# Altium schematic sheet Sheet1.SchDoc: Ranja
size B; Date: 09/30/26; Author: Peter Adebayo; DrawnBy: Peter Adebayo; Engineer: Peter Adebayo; Revision: v1; SheetNumber: 1; SheetTotal: 1; SPICEModelCacheJIALTRMA: <root> / <DocumentId>JIALTRMA</DocumentId> / </root>
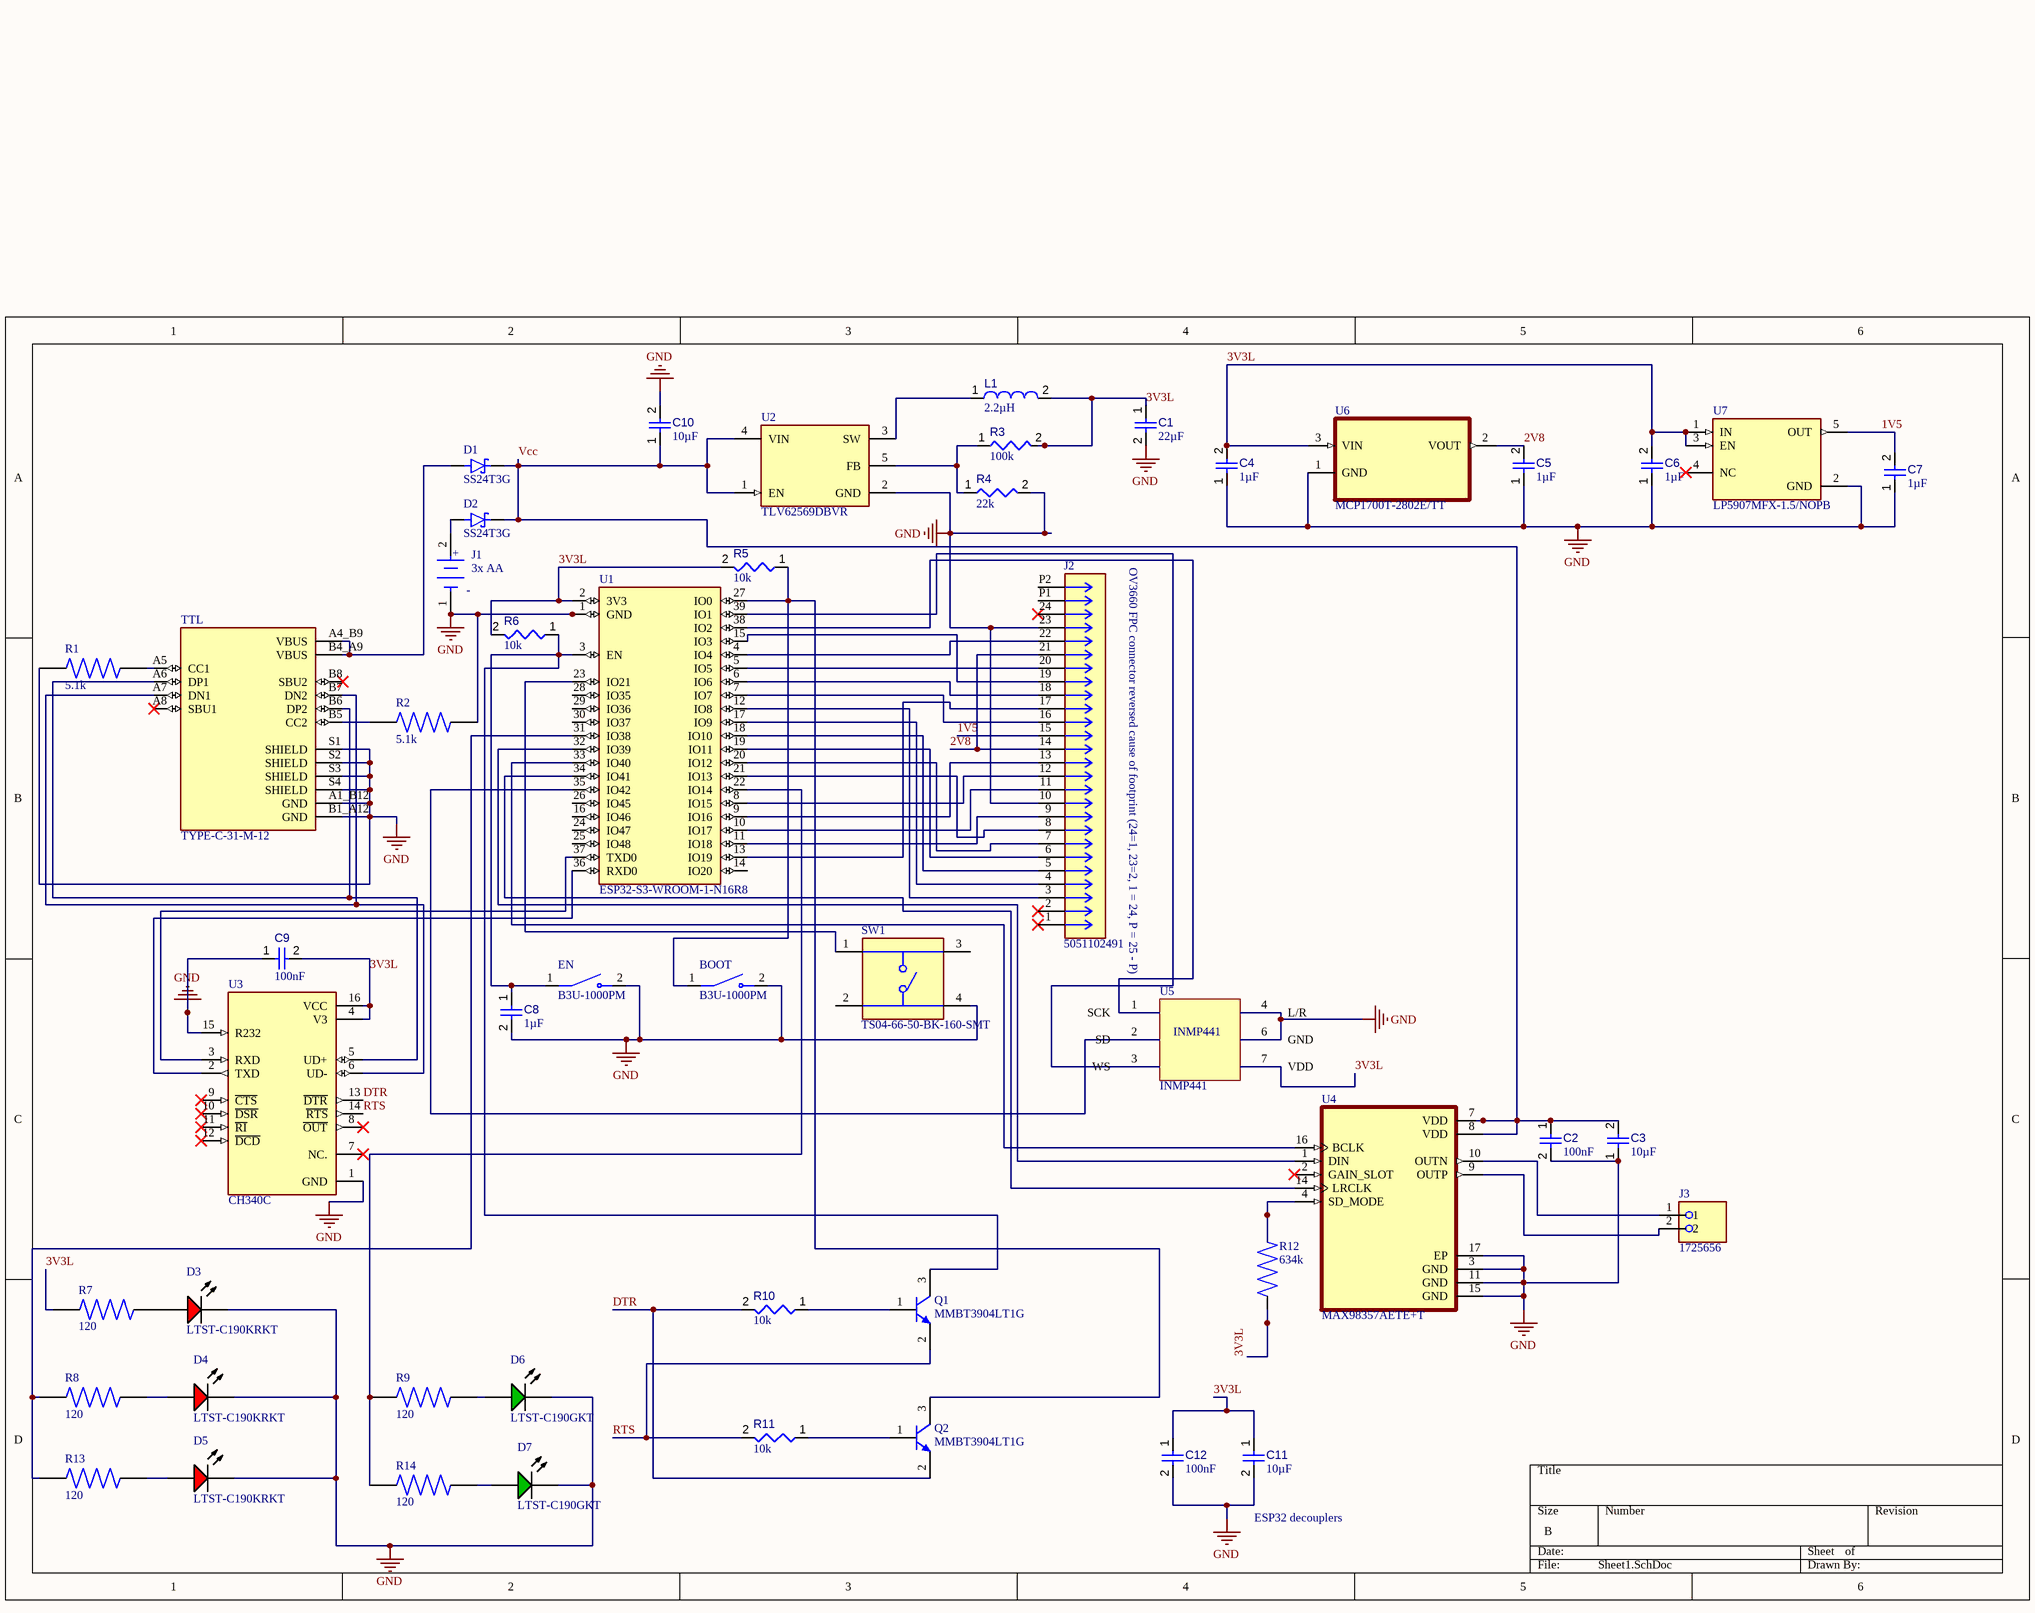
[diagram p0: Sheet1.SchDoc]

## Parts
BOOT  B3U-1000PM  [SW_B3U-1000PM]
C1  value 22µF  [CAPC0805(2012)145_L]  (hidden comment: Capacitor 22µF +/-40% 16V 0805)
C2  value 100nF  [CAPC0402(1005)60_L]  (hidden comment: Capacitor 100nF +/-20% 50V 0402)
C3  value 10µF  [CAPC2013X135X45LL10T25]  (hidden comment: Capacitor 10 uF +/- 10% 16 V 0805)
C4  value 1µF  [CAPC1608X90X35ML15T15]  (hidden comment: Capacitor 1uF +/- 10% 16V 0603)
C5  value 1µF  [CAPC1608X90X35ML15T15]  (hidden comment: Capacitor 1uF +/- 10% 16V 0603)
C6  value 1µF  [CAPC1608X90X35ML15T15]  (hidden comment: Capacitor 1uF +/- 10% 16V 0603)
C7  value 1µF  [CAPC1608X90X35ML15T15]  (hidden comment: Capacitor 1uF +/- 10% 16V 0603)
C8  value 1µF  [CAPC1608X90X35ML15T15]  (hidden comment: Capacitor 1uF +/- 10% 16V 0603)
C9  value 100nF  [CAPC0402(1005)60_L]  (hidden comment: Capacitor 100nF +/-20% 50V 0402)
C10  value 10µF  [CAPC2013X135X45LL10T25]  (hidden comment: Capacitor 10 uF +/- 10% 16 V 0805)
C11  value 10µF  [CAPC2013X135X45LL10T25]  (hidden comment: Capacitor 10 uF +/- 10% 16 V 0805)
C12  value 100nF  [CAPC0402(1005)60_L]  (hidden comment: Capacitor 100nF +/-20% 50V 0402)
D1  SS24T3G  [DIOM5436X247N]
D2  SS24T3G  [DIOM5436X247N]
D3  LTST-C190KRKT  [LTST-C191KRKT_V]
D4  LTST-C190KRKT  [LTST-C191KRKT_V]
D5  LTST-C190KRKT  [LTST-C191KRKT_V]
D6  LTST-C190GKT  [LTST-C190GKT_V]
D7  LTST-C190GKT  [LTST-C190GKT_V]
EN  B3U-1000PM  [SW_B3U-1000PM]
J1  3x AA  [FP-BC3AAPC-MFG]
J2  5051102491  [CON_5051102491_MOL]
J3  1725656  [PHOENIX_1725656]
L1  value 2.2µH  [INDC2520X100X60NL20T20]  (hidden comment: LQM2HPN2R2MG0L)
Q1  MMBT3904LT1G  [ONSC-SOT-23-3-318-08_V]
Q2  MMBT3904LT1G  [ONSC-SOT-23-3-318-08_V]
R1  value 5.1k  [RESC1005X40N]  (hidden comment: RC0402FR-075K1L)
R2  value 5.1k  [RESC1005X40N]  (hidden comment: RC0402FR-075K1L)
R3  value 100k  [RESC0402(1005)_L]  (hidden comment: Resistor 100K +/-1 % 0402 63 mW)
R4  value 22k  [RESC0402(1005)_L]  (hidden comment: Resistor 22K  +/-1 % 0402 63 mW)
R5  value 10k  [RESC0402(1005)_L]  (hidden comment: Resistor 10K  +/-1 % 0402 63 mW)
R6  value 10k  [RESC0402(1005)_L]  (hidden comment: Resistor 10K  +/-1 % 0402 63 mW)
R7  value 120  [RESC1608X55N]  (hidden comment: CRCW0603120RJNEAHP)
R8  value 120  [RESC1608X55N]  (hidden comment: CRCW0603120RJNEAHP)
R9  value 120  [RESC1608X55N]  (hidden comment: CRCW0603120RJNEAHP)
R10  value 10k  [RESC0402(1005)_L]  (hidden comment: Resistor 10K  +/-1 % 0402 63 mW)
R11  value 10k  [RESC0402(1005)_L]  (hidden comment: Resistor 10K  +/-1 % 0402 63 mW)
R12  value 634k  [RESC2012X60N]  (hidden comment: RT0805BRD07634KL)
R13  value 120  [RESC1608X55N]  (hidden comment: CRCW0603120RJNEAHP)
R14  value 120  [RESC1608X55N]  (hidden comment: CRCW0603120RJNEAHP)
SW1  TS04-66-50-BK-160-SMT  [SW_TS04-66-50-BK-160-SMT]
TTL  TYPE-C-31-M-12  [HRO_TYPE-C-31-M-12]
U1  ESP32-S3-WROOM-1-N16R8  [ESP32S3WROOM1N8R2]
U2  TLV62569DBVR  [FP-DBV0005A-IPC_B]
U3  CH340C  [SOIC127P600X180-16N]
U4  MAX98357AETE+T  [QFN50P300X300X80-17N]
U5  INMP441  [MIC_CIRCULAR_BOARD]
U6  MCP1700T-2802E/TT  [SOT95P237X112-3N]
U7  LP5907MFX-1.5/NOPB  [SOT95P280X145-5N]

## Nets
GND: BOOT.2 C1.2 C2.2 C3.1 C4.1 C5.1 C6.1 C7.1 C8.2 C9.1 C10.2 C11.2 C12.2 D3.2(K) D4.2(K) D5.2(K) D6.2(K) D7.2(K) EN.2 J1.1(-) J2.10 J2.23 R1.1 R2.2 R4.2 SW1.4 TTL.A1_B12(GND) TTL.B1_A12(GND) TTL.S1(SHIELD) TTL.S2(SHIELD) TTL.S3(SHIELD) TTL.S4(SHIELD) U1.1(GND) U1.40(GND) U1.41(GND) U1.42(GND) U1.43(GND) U1.44(GND) U1.45(GND) U1.46(GND) U1.47(GND) U1.48(GND) U1.49(GND) U2.2(GND) U3.1(GND) U3.15(R232) U4.3(GND) U4.11(GND) U4.15(GND) U4.17(EP) U5.4(L/R) U5.6(GND) U6.1(GND) U7.2(GND)
1V5: C7.2 J2.15 U7.5(OUT)
2V8: C5.2 J2.14 J2.21 U6.2(VOUT)
3V3L: C1.1 C4.2 C6.2 C9.2 C11.1 C12.1 L1.2 R3.2 R5.2 R6.2 R7.1 R12.1 U1.2(3V3) U3.4(V3) U3.16(VCC) U5.7(VDD) U6.3(VIN) U7.1(IN) U7.3(EN)
DTR: Q2.2(E) R10.2 U3.13(~{DTR})
RTS: Q1.2(E) R11.2 U3.14(~{RTS})
Vcc: C2.1 C3.2 C10.1 D1.C(K) D2.C(K) U2.1(EN) U2.4(VIN) U4.7(VDD) U4.8(VDD)
NetBOOT_1: BOOT.1 Q2.3(C) R5.1 U1.27(IO0)
NetC8_1: C8.1 EN.1 Q1.3(C) R6.1 U1.3(EN)
NetD1_A: D1.A TTL.A4_B9(VBUS) TTL.B4_A9(VBUS)
NetD2_A: D2.A J1.2(+)
NetD3_1: D3.1(A) R7.2
NetD4_1: D4.1(A) R8.2
NetD5_1: D5.1(A) R13.2
NetD6_1: D6.1(A) R9.2
NetD7_1: D7.1(A) R14.2
NetJ2_3: J2.3 U1.12(IO8)
NetJ2_4: J2.4 U1.17(IO9)
NetJ2_5: J2.5 U1.18(IO10)
NetJ2_6: J2.6 U1.19(IO11)
NetJ2_7: J2.7 U1.20(IO12)
NetJ2_8: J2.8 U1.21(IO13)
NetJ2_9: J2.9 U1.11(IO18)
NetJ2_11: J2.11 U1.10(IO17)
NetJ2_12: J2.12 U1.8(IO15)
NetJ2_13: J2.13 U1.9(IO16)
NetJ2_16: J2.16 U1.7(IO7)
NetJ2_17: J2.17 U1.13(IO19)
NetJ2_18: J2.18 U1.6(IO6)
NetJ2_19: J2.19 U1.15(IO3)
NetJ2_20: J2.20 U1.5(IO5)
NetJ2_22: J2.22 U1.4(IO4)
NetJ3_1: J3.1 U4.10(OUTN)
NetJ3_2: J3.2 U4.9(OUTP)
NetL1_1: L1.1 U2.3(SW)
NetQ1_1: Q1.1(B) R10.1
NetQ2_1: Q2.1(B) R11.1
NetR1_2: R1.2 TTL.A5(CC1)
NetR2_1: R2.1 TTL.B5(CC2)
NetR3_1: R3.1 R4.1 U2.5(FB)
NetR8_1: R8.1 R13.1 U1.31(IO38)
NetR9_1: R9.1 R14.1 U1.22(IO14)
NetR12_2: R12.2 U4.4(SD_MODE)
NetSW1_1: SW1.1 U1.23(IO21)
NetTTL_A6: TTL.A6(DP1) TTL.B6(DP2) U3.5(UD+)
NetTTL_A7: TTL.A7(DN1) TTL.B7(DN2) U3.6(UD-)
NetU1_32: U1.32(IO39) U4.1(DIN)
NetU1_33: U1.33(IO40) U4.16(BCLK)
NetU1_34: U1.34(IO41) U4.14(LRCLK)
NetU1_35: U1.35(IO42) U5.2(SD)
NetU1_36: U1.36(RXD0) U3.2(TXD)
NetU1_37: U1.37(TXD0) U3.3(RXD)
NetU1_38: U1.38(IO2) U5.1(SCK)
NetU1_39: U1.39(IO1) U5.3(WS)

Not connected (* = marked no-connect by the designer): J2 1* 2* 24* P1 P2; SW1 2 3; TTL A8(SBU1)* B8(SBU2)*; U1 14(IO20) 16(IO46) 24(IO47) 25(IO48) 26(IO45) 28(IO35) 29(IO36) 30(IO37); U3 7(NC.)* 8(~{OUT})* 9(~{CTS})* 10(~{DSR})* 11(~{RI})* 12(~{DCD})*; U4 2(GAIN_SLOT)*; U7 4(NC)*

## Notes on the sheet
- (near U5) OV3660 FPC connector reversed cause of footprint (24=1, 23=2, 1 = 24, P = 25 - P)
- (near C11) ESP32 decouplers

## Library data of the parts
BOOT EN = CMP-021-000000-2: Top, w/o Boss 1k Reel; MF: Omron; Component Type: Standard; Pin Count: 2; Design Item ID: B3U-1000PM; Source: B3U-1000PM.SchLib; Value: *; SnapEDA_Link: https://www.snapeda.com/parts/B3U-1000PM/Omron/view-part/?ref=snap; Check_prices: https://www.snapeda.com/parts/B3U-1000PM/Omron/view-part/?ref=eda; Package: Custom Package Omron; MP: B3U-1000PM
C1 = CMP-001-00081-4: Chip Capacitor, 22µF +/-40%, 16V, 0805, Thickness 1.45 mm; Tolerance: 5%; Voltage Rating: 16V; Mounting Technology: SMT; Pins: 2; Max Operating Temperature: 85°C; Case/Package: 0805; Min Operating Temperature: -55°C
C2 C9 C12 = CMP-001-00067-3: Chip Capacitor, 100nF +/-20%, 50V, 0402, Thickness 0.6 mm; Tolerance: 10%; Min Operating Temperature: -55°C; Pins: 2; Case/Package: 0402; Max Operating Temperature: 85°C; Voltage Rating: 50V; Mounting Technology: SMT
C3 C10 C11 = CMP-001-00015-6: Chip Capacitor, 10 uF, +/- 10%, 16 V, 0805 (2012 Metric); Voltage Rating: 16V; Capacitor Type: Ceramic; RoHS Compliant: True; Max Operating Temperature: 85°C; Min Operating Temperature: -55°C; Mounting Technology: SM; Tolerance: 10%; Case/Package: 0805; Pins: 2
C4-C8 = CMP-001-00004-6: Chip Capacitor, 1 uF, +/- 10%, 16 V, 0603 (1608 Metric); Capacitor Type: Ceramic; Mounting Technology: SM; RoHS Compliant: True; Min Operating Temperature: -55°C; Case/Package: 0603; Pins: 2; Voltage Rating: 16V; Max Operating Temperature: 125°C; Tolerance: 10%
D1 D2 = CMP-004-00032-2: Diode Schottky 40 V 2A Surface Mount SMB; MF: onsemi; SnapEDA_Link: https://www.snapeda.com/parts/SS24T3G/Onsemi/view-part/?ref=snap; MP: SS24T3G; Pins: 2; Value: *; Design Item ID: SS24T3G; Source: SS24T3G.SchLib; Component Type: Standard; Case/Package: SMB-2 ON Semiconductor; Check_prices: https://www.snapeda.com/parts/SS24T3G/Onsemi/view-part/?ref=eda
D3-D5 = CMP-007-00024-2: LED Uni-Color Red, 62.5 mW, 25 mA, -30 to 85 degC, 2-Pin SMD, RoHS, Tape and Reel; Manufacturer: Lite-On; Power: 75mW; Forward Voltage: 2V; Luminous Intensity: 54mcd; Lens Style: Diffused; Viewing Angle: 130degrees; Forward Current: 20mA; Manufacturer URL: http://www.us.liteon.com/; Case/Package: 0603; Datasheet Version: Rev. F, 05/2013; Package Reference: C191KRKT; Datasheet URL: http://optoelectronics.liteon.com/upload/download/DS-22-99-0151/S_110_LTST-C190KRKT.pdf; Package Description: 2-Pin Surface Mount Device, Body 1.6 x 0.8 mm; Nominal Vf: 2V; Packaging: TapeandReel; RoHS Compliant: True; Pins: 2; Illumination Colour: Red; Colour: Red; Mounting Technology: SM; Package Quantity: 3000; Min Operating Temperature: -55°C; Max Operating Temperature: 85°C
D6 D7 = CMP-007-00022-2: LED Uni-Color Green, 100 mW, 30 mA, -55 to 85 degC, 2-Pin SMD, RoHS, Tape and Reel; Manufacturer: Lite-On; Power: 100mW; Forward Voltage: 2.1V; Viewing Angle: 130degrees; Forward Current: 20mA; Luminous Intensity: 6mcd; Lens Style: Clear; Manufacturer URL: http://www.us.liteon.com/; RoHS Compliant: True; Colour: Green; Package Description: 2-Pin Surface Mount Device, Body 1.6 x 0.8 mm; Datasheet URL: http://datasheet.octopart.com/LTST-C190GKT-Lite-On-datasheet-158530.pdf; Datasheet Version: Dec-06; Mounting Technology: SM; Case/Package: 0603; Package Reference: C190GKT; Packaging: TapeandReel; Min Operating Temperature: -55°C; Nominal Vf: 2.1V; Package Quantity: 3000; Illumination Colour: Green; Max Operating Temperature: 85°C; Pins: 2
J1 = CMP-00029-00001-1: Battery Holder 3 Cells AA Size Polypropylene; Number of Cells: 3; Min Operating Temperature: -10°C; RoHS: Compliant; Max Operating Temperature: 100°C; Mounting Technology: PCB, Through Hole; Termination: PC Pin; Height: 17mm
J2 = CMP-002-00081-2: 24 Position FFC, FPC Connector Contacts, Bottom 0.020 (0.50mm) Surface Mount, Right Angle; MF: Molex; Source: 5051102491.SchLib; Pins: 26; Check_prices: https://www.snapeda.com/parts/5051102491/Molex/view-part/?ref=eda; SnapEDA_Link: https://www.snapeda.com/parts/5051102491/Molex/view-part/?ref=snap; Component Type: Standard; Design Item ID: 5051102491; Case/Package: None; MP: 5051102491; Value: *
J3 = CMP-035-000001-1: PCB Terminal Screw 2.54mm 20AWG 160V 6A 2 Position COMBICON MPT Series; MF: Phoenix Contact; Component Type: Standard; Package: None; Design Item ID: 1725656; Check_prices: https://www.snapeda.com/parts/1725656/Phoenix+Contact/view-part/?ref=eda; Pin Count: 2; Value: *; SnapEDA_Link: https://www.snapeda.com/parts/1725656/Phoenix+Contact/view-part/?ref=snap; Source: 1725656.SchLib; MP: 1725656
L1 = CMP-006-00009-6: Chip Inductor, 2.2 uH, +/- 20%, -55 to 125 degC, 1008 (2520 Metric), RoHS, Tape and Reel; Manufacturer: Murata; Self Resonant Frequency: 40MHz; Current Rating: 1.3A; Core Material: Ferrite; Shielding: Shielded; Package Description: 2-Pin Surface Mounted Device, Body 2.5 x 2 mm; Tolerance: 20%; Max Operating Temperature: 125°C; Mounting Technology: SM; Package Reference: 1008; Case/Package: 1008; RoHS Compliant: True; Package Quantity: 3000; Packaging: TapeandReel; Min Operating Temperature: -55°C; Datasheet URL: http://psearch.en.murata.com/inductor/product/LQM2HPN2R2MG0%23.pdf; Datasheet Version: Aug-16
Q1 Q2 = CMP-013-00007-3: General Purpose Transistor, NPN Silicon, 40 V, 0.2 A, -55 to 150 degC, 3-Pin SOT23, RoHS, Tape and Reel; Manufacturer: ON Semiconductor; Elements: 1; Power: 225mW; Frequency: 300MHz; hFE Min: 80; Vce Max: 300mV; Mounting Technology: SM; Min Operating Temperature: -55°C; Datasheet URL: http://www.onsemi.cn/pub_link/Collateral/MMBT3904LT1-D.PDF; Pins: 3; Package Description: 3-Pin Small Outline Transistor, Body 2.9 x 1.3 mm, Pitch 0.95 mm; Max Operating Temperature: 150°C; Package Reference: SOT-23 (318-08); Package Quantity: 3000; RoHS Compliant: True; Packaging: TapeandReel; Datasheet Version: Rev. 12, 11/2012; Case/Package: TO-236-3
R1 R2 = CMP-009-00178-1: 5.1 kOhms Â±1% 0.063W, 1/16W Chip Resistor 0402 (1005 Metric) Moisture Resistant Thick Film; MF: Yageo; Case/Package: 1005 Panasonic Electronic Components; Check_prices: https://www.snapeda.com/parts/RC0402FR-075K1L/Yageo/view-part/?ref=eda; Component Type: Standard; Source: RC0402FR-075K1L.SchLib; Pins: 2; SnapEDA_Link: https://www.snapeda.com/parts/RC0402FR-075K1L/Yageo/view-part/?ref=snap; Design Item ID: RC0402FR-075K1L; MP: RC0402FR-075K1L
R3 = CMP-009-00168-3: Chip Resistor, 100 kOhms, +/-1 %, 63 mW, -55 to 155 degC, 0402; Tolerance: 1%; Power: 63mW; Max Operating Temperature: 155°C; Min Operating Temperature: -55°C; Pins: 2; Case/Package: 0402
R4 = CMP-009-00123-3: Chip Resistor, 22 kOhms, +/-1 %, 63 mW, -55 to 155 degC, 0402; Power: 63mW; Tolerance: 1%; Pins: 2; Min Operating Temperature: -55°C; Max Operating Temperature: 155°C; Case/Package: 0402
R5 R6 R10 R11 = CMP-009-00149-3: Chip Resistor, 10 kOhms, +/-1 %, 63 mW, -55 to 125 degC, 0402; Power: 63mW; Tolerance: 1%; Min Operating Temperature: -55°C; Case/Package: 0402; Max Operating Temperature: 155°C; Pins: 2
R7-R9 R13 R14 = CMP-009-00185-1: 120 Ohms Â±5% 0.333W, 1/3W Chip Resistor 0603 (1608 Metric) Automotive AEC-Q200, Pulse Withstanding Thick Film; MF: Vishay Dale; Component Type: Standard; Source: CRCW0603120RJNEAHP.SchLib; Pins: 2; Design Item ID: CRCW0603120RJNEAHP; MP: CRCW0603120RJNEAHP; Case/Package: 1608 Vishay; SnapEDA_Link: https://www.snapeda.com/parts/CRCW0603120RJNEAHP/Vishay+Dale/view-part/?ref=snap; Check_prices: https://www.snapeda.com/parts/CRCW0603120RJNEAHP/Vishay+Dale/view-part/?ref=eda
R12 = CMP-009-00181-1: 634 kOhms Â±0.1% 0.125W, 1/8W Chip Resistor 0805 (2012 Metric) Thin Film; MF: Yageo; SnapEDA_Link: https://www.snapeda.com/parts/RT0805BRD07634KL/Yageo/view-part/?ref=snap; Check_prices: https://www.snapeda.com/parts/RT0805BRD07634KL/Yageo/view-part/?ref=eda; Source: RT0805BRD07634KL.SchLib; Pins: 2; Design Item ID: RT0805BRD07634KL; Component Type: Standard; Case/Package: 2012 Yageo; MP: RT0805BRD07634KL
SW1 = CMP-011-00013-1: 6 x 6 mm, 5 mm Actuator Height, 160 gf, Black, Surface Mount, SPST, Tactile Switch; MF: Same Sky; Value: *; Case/Package: None; Source: TS04-66-50-BK-160-SMT.SchLib; MP: TS04-66-50-BK-160-SMT; SnapEDA_Link: https://www.snapeda.com/parts/TS04-66-50-BK-160-SMT/Same+Sky/view-part/?ref=snap; Design Item ID: TS04-66-50-BK-160-SMT; Component Type: Standard; Check_prices: https://www.snapeda.com/parts/TS04-66-50-BK-160-SMT/Same+Sky/view-part/?ref=eda; Pins: 4
TTL = CMP-051-000000-1: USB Connectors 24 Receptacle 1 8.94*7.3mm RoHS; MF: HRO Electronics Co., Ltd.; Component Type: Standard; SnapEDA_Link: https://www.snapeda.com/parts/TYPE-C-31-M-12/HRO+Electronics+Co.%252C+Ltd./view-part/?ref=snap; Source: TYPE-C-31-M-12.SchLib; Check_prices: https://www.snapeda.com/parts/TYPE-C-31-M-12/HRO+Electronics+Co.%252C+Ltd./view-part/?ref=eda; Pin Count: 16; MP: TYPE-C-31-M-12; Package: Package; Design Item ID: TYPE-C-31-M-12; Value: *
U1 = ESP32-S3-WROOM-1-N16R8: Bluetooth, WiFi 802.11b/g/n, Bluetooth v5.0 Transceiver Module 2.4GHz PCB Trace Surface Mount; MF: Espressif Systems; SnapEDA_Link: https://www.snapeda.com/parts/ESP32-S3-WROOM-1-N16R8/Espressif+Systems/view-part/?ref=snap; Package: NON STANDARD Espressif Systems; Value: *; MP: ESP32-S3-WROOM-1-N16R8; Check_prices: https://www.snapeda.com/parts/ESP32-S3-WROOM-1-N16R8/Espressif+Systems/view-part/?ref=eda
U2 = CMP-031-00006-1: IC REG BUCK ADJ 2A SOT23-5 "Buck Switching Regulator IC Positive Adjustable 0.6V Output 2A SC-74A, SOT-753"; Manufacturer Lifecycle Status: ACTIVE; Max Junction Temperature (Tj): 125°C; Number of Outputs: 1; Max Supply Voltage: 5.5V; Max Duty Cycle: 100%; Switching Frequency: 1.5MHz; Min Supply Voltage: 2.5V; Nominal Supply Current: 35µA; Lifecycle Status: Production; Output Current: 2A; Case/Package: SOT-23; RoHS: Compliant; Max Operating Temperature: 125°C; Topology: Buck; Height: 1.45mm; Min Operating Temperature: -40°C; Schedule B: 8542390000, 8542390000; Length: 2.9mm; Pins: 5; Thickness: 1.2mm; Output Voltage: 5.5V; Packaging: Cut Tape; Width: 1.6mm
U3 = CMP-011-000000-1: USB to serial chip CH340; MF: WCH; Design Item ID: CH340C; Availability: Not in stock; Pin Count: 16; Component Type: Standard; MP: CH340C; Value: *; Price: None; SnapEDA_Link: https://www.snapeda.com/parts/CH340C/WCH/view-part/?ref=snap; Check_prices: https://www.snapeda.com/parts/CH340C/WCH/view-part/?ref=eda; Source: CH340C.SchLib; Package: None
U4 = CMP-014-00002-1: Tiny, Low-Cost, PCM Class D Amplifier with Class AB Performance; MF: Analog Devices; MP: MAX98357AETE+T; Pins: 13; Design Item ID: MAX98357AETE+T; Value: *; Source: MAX98357AETE+T.SchLib; Check_prices: https://www.snapeda.com/parts/MAX98357AETE+T/Analog+Devices/view-part/?ref=eda; SnapEDA_Link: https://www.snapeda.com/parts/MAX98357AETE+T/Analog+Devices/view-part/?ref=snap; Component Type: Standard; Case/Package: TQFN-16 Maxim
U6 = CMP-029-000000-1: 250mA CMOS LDO, Isupply 1uA and 2% Vout Accuracy3 SOT-23 T/R; MF: Microchip; Pin Count: 3; Source: MCP1700T-2802E_TT.SchLib; Package: SOT-23 Microchip; Value: *; Check_prices: https://www.snapeda.com/parts/MCP1700T-2802E/TT/Microchip/view-part/?ref=eda; Component Type: Standard; Design Item ID: MCP1700T-2802E/TT; MP: MCP1700T-2802E/TT; SnapEDA_Link: https://www.snapeda.com/parts/MCP1700T-2802E/TT/Microchip/view-part/?ref=snap
U7 = CMP-059-000001-3: 250-mA, low-noise, high-PSRR, ultra-low-dropout voltage regulator with low IQ and enable, 1.5V fixed output; MF: {'manufacturer': u'Texas Instruments'}; Price: None; Availability: Unavailable; MP: LP5907MFX-1.5/NOPB; Value: *; Pin Count: 5; Package: None; Design Item ID: LP5907MFX-1.5/NOPB; Source: LP5907MFX-1.5_NOPB.SchLib; Component Type: Standard